# Altium schematic sheet Balancer-v7.0.1.SchDoc
size A4; SheetNumber: 1; SheetTotal: 1; ImagePath: C:\Users\eSpark\Documents\GitHub\eSpark-Hardware\Altium Template
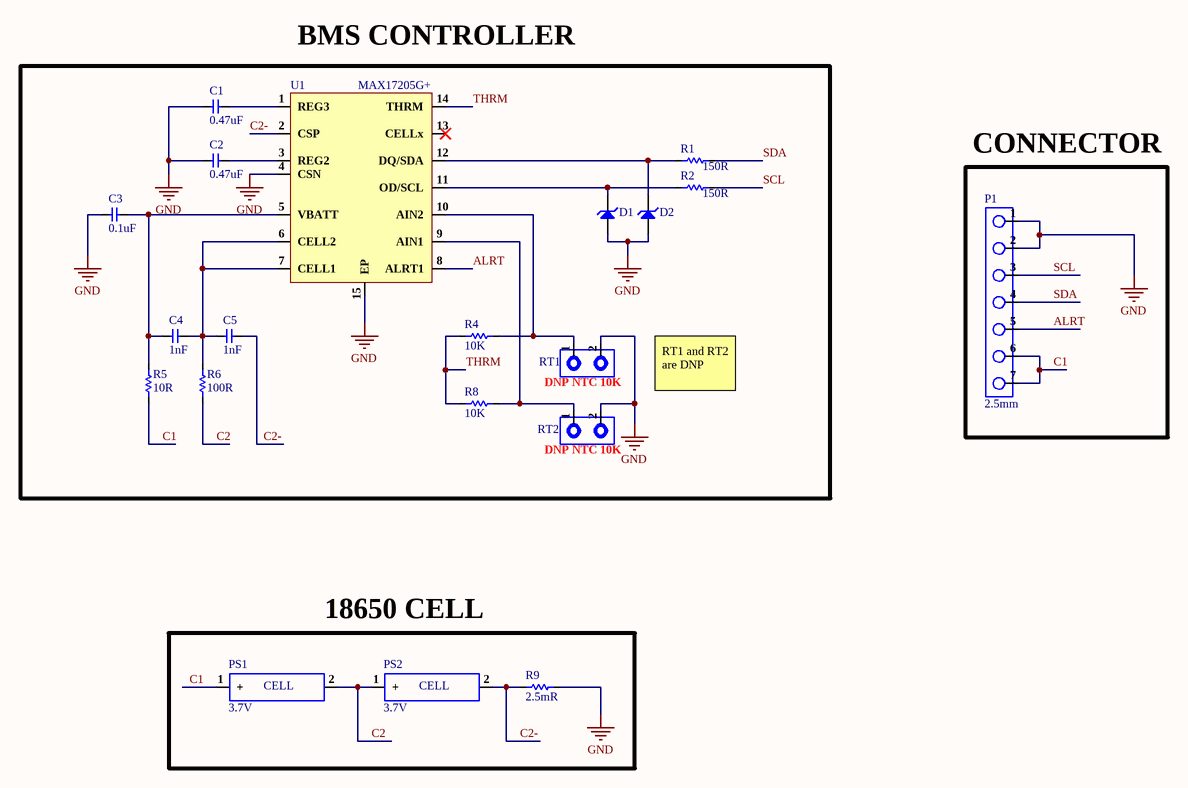
[diagram p0: Balancer-v7.0.1.SchDoc]

## Parts
C1  0.47uF  [Cap-0402]
C2  0.47uF  [Cap-0402]
C3  0.1uF  [Cap-0402]
C4  1nF  [Cap-0603]
C5  1nF  [Cap-0603]
D1  BZX38450-C4V7-QX  [SOD-323]  (value not drawn)
D2  BZX38450-C4V7-QX  [SOD-323]  (value not drawn)
P1  2.5mm  [Header CON]
PS1  3.7V  [18650 CELL PAD]
PS2  3.7V  [18650 CELL PAD]
R1  150R  [Res-0603]
R2  150R  [Res-0603]
R4  10K  [Res-0603]
R5  10R  [Res-1206]
R6  100R  [Res-1206]
R8  10K  [Res-0603]
R9  2.5mR  [RES-2512]
RT1  DNP NTC 10K  [Thermistor]
RT2  DNP NTC 10K  [Thermistor]
U1  MAX17205G+  [TDFN-14-EP(3x3)]

## Blocks framed on the sheet
BMS CONTROLLER: C1-C5 D1 D2 R1 R2 R4-R6 R8 RT1 RT2 U1
CONNECTOR: P1
18650 CELL: PS1 PS2 R9

## Nets
GND: C1.1 C2.1 C3.1 D1.2(A) D2.2(A) P1.1 P1.2 R9.2 RT1.2 RT2.2 U1.4(CSN) U1.15(EP)
ALRT: P1.5 U1.8(ALRT1)
C1: P1.6 P1.7 PS1.1(+) R5.1
C2: PS1.2(-) PS2.1(+) R6.1
C2-: C5.2 PS2.2(-) R9.1 U1.2(CSP)
SCL: P1.3 R2.2
SDA: P1.4 R1.2
THRM: R4.1 R8.1 U1.14(THRM)
NetC1_2: C1.2 U1.1(REG3)
NetC2_2: C2.2 U1.3(REG2)
NetC3_2: C3.2 C4.1 R5.2 U1.5(VBATT)
NetC4_2: C4.2 C5.1 R6.2 U1.6(CELL2) U1.7(CELL1)
NetD1_1: D1.1(K) R2.1 U1.11(OD/SCL)
NetD2_1: D2.1(K) R1.1 U1.12(DQ/SDA)
NetR4_2: R4.2 RT1.1 U1.10(AIN2)
NetR8_2: R8.2 RT2.1 U1.9(AIN1)

Not connected (* = marked no-connect by the designer): U1 13(CELLx)*

## Notes on the sheet
- RT1 and RT2 are DNP
- File:
- Title:
- Date:
- Page
- Num:
- Total:
- Drawn By: Huzaifa Ali
- (in symbol 18650 CELL) CELL

## Library data of the parts
C1 C2 = GRM155R71C474KE01D: CAP CER 0.47uF, 16V, X7R, 10% Tol, 0402 Multilayer Ceramic Capacitors MLCC - SMD/SMT ROHS; Manufacturer: Murata Electronics; Manufacturer Part Number: GRM155R71C474KE01D; Package: 0402; LCSC Part Number: C471404; Item Type: Capacitor
C3 = 04023C104KAT2A: CAP CER, 0.1 uF, 25 V, ± 10%, X7R, 0402 [1005 Metric]; Manufacturer: Kyocera AVX; Material: 4241ConductorMaterial; Value: 100nF; Voltage Rating (DC): 25V; Item Type: Capacitor; Supplier: Farnell; Supplier Part Number: 1867948; Manufacturer Part Number: 04023C104KAT2A; RoHS: Yes; Category: Ceramic Capacitors; Stock: 226682; Pricing: 10=0.027, 100=0.014, 500=0.009, 2500=0.007, 5000=0.0069 (GBP); Mounting Technology: Surface Mount; Case/Package: 0402; Pins: 2; Case Code (Metric): 1005; Case Code (Imperial): 0402; Min Operating Temperature: -55°C; Max Operating Temperature: 125°C; Tolerance: 10%; Dielectric: X7R; Packaging: Cut Tape; Voltage Rating: 25V; Voltage: 25V; Series: -; Width: 1mm; Reach SVHC Compliant: No; Lead Free: 5697LeadFree; RoHS Compliant: Yes; ComponentLink1URL: https://datasheet.ciiva.com/7614/cx7r-7614663.pdf?src-supplier=Digi-Key; ComponentLink1Description: https://datasheet.ciiva.com/7614/cx7r-7614663.pdf?src-supplier=Digi-Key; ComponentLink2URL: https://datasheet.ciiva.com/6265/cx7r-6265272.pdf?src-supplier=Digi-Key; ComponentLink2Description: https://datasheet.ciiva.com/6265/cx7r-6265272.pdf?src-supplier=Digi-Key; ComponentLink3URL: https://datasheet.ciiva.com/1123/1679506-1123344.pdf?src-supplier=Element14; ComponentLink3Description: https://datasheet.ciiva.com/1123/1679506-1123344.pdf?src-supplier=Element14; ComponentLink4URL: https://datasheet.ciiva.com/14906/cx7r-14906223.pdf?src-supplier=Digi-Key; ComponentLink4Description: https://datasheet.ciiva.com/14906/cx7r-14906223.pdf?src-supplier=Digi-Key; ComponentLink5URL: https://datasheet.ciiva.com/7709/1679506-7709527.pdf?src-supplier=Element14; ComponentLink5Description: https://datasheet.ciiva.com/7709/1679506-7709527.pdf?src-supplier=Element14; ComponentLink6Description: Farnell; ComponentLink6URL: https://uk.farnell.com/avx/04023c104kat2a/cap-0-1-f-25v-10-x7r-0402/dp/1867948
C4 C5 = C0603C102K3RACAUTO: CAP CER, 1000 pF, 25 V, ± 10%, X7R, 0603 [1608 Metric]; Manufacturer: KEMET; Dielectric Material: Ceramic; Voltage Rating: 25V; Item Type: Capacitor; Supplier: Newark; Supplier Part Number: 07X0745; Manufacturer Part Number: C0603C102K3RACAUTO; RoHS: Yes; Category: Ceramic Capacitors; Stock: 3765; Pricing: 1=0.014 (USD); Mounting Technology: Surface Mount; Package: 0603; Case Code (Metric): 1608; Case Code (Imperial): 0603; Min Operating Temperature: -55°C; Max Operating Temperature: 125°C; Value: 1nF; Tolerance: 10%; Package Quantity: 1; Packaging: Cut Tape; Dielectric: X7R; Voltage Rating (DC): 25V; Series: C; Construction: Flat; Length: 1.6mm; Width: 0.031inch; Height: 0.8mm; Thickness: 0.034inch; Depth: 0.8mm; Ratings: AEC-Q200; Radiation Hardening: No; RoHS Compliant: Yes; Reach SVHC Compliant: No; ComponentLink1URL: https://datasheet.ciiva.com/23913/1751276-23913166.pdf?src-supplier=Newark; ComponentLink1Description: https://datasheet.ciiva.com/23913/1751276-23913166.pdf?src-supplier=Newark; ComponentLink2URL: https://datasheet.ciiva.com/26847/getdatasheetpartid-429233-26847500.pdf?src-supplier=Verical; ComponentLink2Description: https://datasheet.ciiva.com/26847/getdatasheetpartid-429233-26847500.pdf?src-supplier=Verical; ComponentLink3Description: Newark; ComponentLink3URL: https://www.newark.com/kemet/c0603c102k3racauto/mlcc-capacitor-1000pf-25v-x7r/dp/07X0745
D1 D2 = BZX38450-C4V7-QX: Zener Diode 4.7 V 300 mW ±5% Surface Mount SOD-323; Manufacturer: Nexperia USA Inc.; Manufacturer Part Number: BZX38450-C4V7-QX; Package: SC-76, SOD-323; Item Type: Diode; ComponentLink1Description: Farnell; ComponentLink1URL: https://uk.farnell.com/nexperia/bzx38450-c4v7-qx/zener-diode-4-7v-0-3w-sc-76/dp/3868843; ComponentLink2Description: Digikey; ComponentLink2URL: https://www.digikey.com/en/products/detail/nexperia-usa-inc/BZX38450-C4V7-QX/16368564
P1 = Header CON 2.5mm: 2.5mm Pitch, 7 Pin header Connector
PS1 PS2 = 18650 CELL: Will only be pads on PCB for Welding. Not CELL holder
R1 R2 = MCWR06X1500FTL: SMD RES, 150 Ohm, General Purpose Thick Film 0603 1% 1/10W ±100ppm/°C Ceramic Paper T/R; Manufacturer: Multicomp; Voltage Rating: 50V; Power Rating: 100mW; Item Type: Resistor; Supplier: Farnell; Supplier Part Number: 2446572; Manufacturer Part Number: MCWR06X1500FTL; RoHS: Yes; Stock: 85000; Pricing: 5000=0.001, 25000=0.0009, 50000=0.0008 (GBP); Case/Package: 0603; Case Code (Metric): 1608; Case Code (Imperial): 0603; Value: 150R; Packaging: Tape and Reel; Resistor Type: Thick Film; Temperature Coefficient: 100ppm/°C; Voltage Rating (DC): 50V; Resistance Tolerance: 1%; Reach SVHC Compliant: No; ComponentLink1URL: http://www.farnell.com/datasheets/2563624.pdf?src-supplier=Farnell; ComponentLink1Description: http://www.farnell.com/datasheets/2563624.pdf?src-supplier=Farnell; ComponentLink2URL: http://www.farnell.com/datasheets/2860681.pdf?src-supplier=Farnell; ComponentLink2Description: http://www.farnell.com/datasheets/2860681.pdf?src-supplier=Farnell; ComponentLink3URL: https://datasheet.octopart.com/MCWR06X1500FTL-Multicomp-datasheet-100454308.pdf?src-supplier=Farnell; ComponentLink3Description: https://datasheet.octopart.com/MCWR06X1500FTL-Multicomp-datasheet-100454308.pdf?src-supplier=Farnell; ComponentLink4URL: http://www.farnell.com/datasheets/1849611.pdf?src-supplier=Element14; ComponentLink4Description: http://www.farnell.com/datasheets/1849611.pdf?src-supplier=Element14; ComponentLink5URL: http://www.farnell.com/datasheets/2563624.pdf?src-supplier=Newark; ComponentLink5Description: http://www.farnell.com/datasheets/2563624.pdf?src-supplier=Newark
R4 R8 = RE0603DRE0710KL: SMD RES, 10KOhm, ± 0.5%, 100 mW, 0603 [1608 Metric], Thick Film, Ultra Precision; Manufacturer: Yageo; Value: 10kR; Max Power Dissipation: 100mW; Temperature Coefficient: 50ppm/°C; Item Type: Resistor; Supplier: Farnell; Supplier Part Number: 1840588; Manufacturer Part Number: RE0603DRE0710KL; RoHS: Yes; Category: Chip SMD Resistors; Stock: 3920; Pricing: 10=0.025, 100=0.014, 500=0.013, 1000=0.011, 2500=0.009, 5000=0.007, 25000=0.006, 50000=0.005 (GBP); Case/Package: 0603; Min Operating Temperature: -55°C; Max Operating Temperature: 155°C; Packaging: Tape and Reel; Number of Terminations: 2; Tolerance: 0.5%; Features: Moisture Resistant; Series: RE; Length: 0.063inch; Width: 0.032inch; Height: 0.022inch; RoHS Compliant: Yes; ComponentLink1URL: http://www.yageo.com/NewPortal/yageodocoutput?fileName=/pdf/R-Chip/PYu-RE_105_RoHS_L_6.pdf&src-supplier=Digi-Key; ComponentLink1Description: http://www.yageo.com/NewPortal/yageodocoutput?fileName=/pdf/R-Chip/PYu-RE_105_RoHS_L_6.pdf&src-supplier=Digi-Key; ComponentLink2Description: Farnell; ComponentLink2URL: https://uk.farnell.com/yageo/re0603dr-0710kl/res-10k-0-5-0-1w-0603-thick-film/dp/1840588
R5 = RC1206FR-0710RL: SMD RES, 10 Ohm, ± 1%, 250 mW, 1206 [3216 Metric], Thick Film, General Purpose; Manufacturer: Yageo; Temperature Coefficient: 200ppm/°C; Voltage Rating (DC): 200V; Power Rating: 250mW; Item Type: Resistor; Supplier: Farnell; Supplier Part Number: 2421908; Manufacturer Part Number: RC1206FR-0710RL; RoHS: Yes; Category: Chip SMD Resistors; Stock: 95000; Pricing: 5000=0.016, 25000=0.014, 50000=0.012 (GBP); Case/Package: 1206; Pins: 2; Case Code (Metric): 3216; Package: 1206; Min Operating Temperature: -55°C; Max Operating Temperature: 155°C; Tolerance: 1%; Value: 10R; Resistor Type: Thick Film; Packaging: Tape and Reel; Voltage Rating: 200V; Number of Terminations: 2; Termination: SMD/SMT; Max Power Dissipation: 250mW; Features: Moisture Resistant; Series: RC; Resistance Tolerance: 1%; Technology: THICK FILM; Voltage Rating (AC): 200V; Length: 3.1mm; Width: 1.6mm; Height: 0.55mm; Depth: 1.6mm; Reach SVHC Compliant: No; Lead Free: Lead Free; RoHS Compliant: Yes; ComponentLink1URL: https://datasheet.ciiva.com/11819/0900766b80c6630a-11819896.pdf?src-supplier=Rs; ComponentLink1Description: https://datasheet.ciiva.com/11819/0900766b80c6630a-11819896.pdf?src-supplier=Rs; ComponentLink2URL: https://datasheet.ciiva.com/22735/444357-22735648.pdf?src-supplier=Farnell; ComponentLink2Description: https://datasheet.ciiva.com/22735/444357-22735648.pdf?src-supplier=Farnell; ComponentLink3URL: https://datasheet.ciiva.com/29181/402303-da-01-en-smd-widerstand-chip1206-10-ohm-29181572.pdf?src-supplier=Conrad; ComponentLink3Description: https://datasheet.ciiva.com/29181/402303-da-01-en-smd-widerstand-chip1206-10-ohm-29181572.pdf?src-supplier=Conrad; ComponentLink4URL: https://datasheet.ciiva.com/46445/444357-46445704.pdf?src-supplier=Element14; ComponentLink4Description: https://datasheet.ciiva.com/46445/444357-46445704.pdf?src-supplier=Element14; ComponentLink5URL: https://datasheet.ciiva.com/2460/pyu-rc1206-51-rohs-l-4-2460048.pdf?src-supplier=Digi-Key; ComponentLink5Description: https://datasheet.ciiva.com/2460/pyu-rc1206-51-rohs-l-4-2460048.pdf?src-supplier=Digi-Key; ComponentLink6URL: https://datasheet.ciiva.com/2460/pyu-rc1206-51-rohs-l-4-2460049.pdf?src-supplier=Digi-Key; ComponentLink6Description: https://datasheet.ciiva.com/2460/pyu-rc1206-51-rohs-l-4-2460049.pdf?src-supplier=Digi-Key; ComponentLink7URL: https://datasheet.ciiva.com/2460/pyu-rc1206-51-rohs-l-4-2460050.pdf?src-supplier=Digi-Key; ComponentLink7Description: https://datasheet.ciiva.com/2460/pyu-rc1206-51-rohs-l-4-2460050.pdf?src-supplier=Digi-Key; ComponentLink8URL: https://datasheet.ciiva.com/16962/pyu-rc1206-51-rohs-l-4-16962857.pdf?src-supplier=Future+Electronics; ComponentLink8Description: https://datasheet.ciiva.com/16962/pyu-rc1206-51-rohs-l-4-16962857.pdf?src-supplier=Future+Electronics; ComponentLink9Description: Farnell; ComponentLink9URL: https://uk.farnell.com/yageo/rc1206fr-0710rl/res-10r-1-0-25w-1206-thick-film/dp/2421908
R6 = RC1206FR-07100RL: SMD RES, 100 Ohm, ± 1%, 250 mW, 1206 [3216 Metric], Thick Film, General Purpose; Manufacturer: Yageo; Power Rating: 250mW; Voltage Rating: 200V; Temperature Coefficient: 100ppm/°C; Item Type: Resistor; Supplier: Farnell; Supplier Part Number: 9240888; Manufacturer Part Number: RC1206FR-07100RL; RoHS: Yes; Category: Chip SMD Resistors; Stock: 538979; Pricing: 10=0.022, 100=0.013, 500=0.011, 1000=0.009, 2500=0.0088 (GBP); Package: 1206; Case Code (Imperial): 1206; Case Code (Metric): 3216; Min Operating Temperature: -55°C; Max Operating Temperature: 155°C; Tolerance: 1%; Packaging: Tape and Reel; Value: 100R; Package Quantity: 5000; Termination: SMD/SMT; Resistor Type: Thick Film; Features: Moisture Resistant; Series: RC; Max Power Dissipation: 250mW; Number of Terminations: 2; Resistance Tolerance: 1%; Technology: THICK FILM; Voltage Rating (AC): 200V; Length: 3.1mm; Width: 1.6mm; Height: 0.55mm; Depth: 1.6mm; Lead Free: Lead Free; RoHS Compliant: Yes; Reach SVHC Compliant: Unknown; ComponentLink1URL: https://datasheet.ciiva.com/11808/0900766b80c6630a-11808606.pdf?src-supplier=Rs; ComponentLink1Description: https://datasheet.ciiva.com/11808/0900766b80c6630a-11808606.pdf?src-supplier=Rs; ComponentLink2URL: https://datasheet.ciiva.com/46445/444357-46445702.pdf?src-supplier=Element14; ComponentLink2Description: https://datasheet.ciiva.com/46445/444357-46445702.pdf?src-supplier=Element14; ComponentLink3URL: https://datasheet.ciiva.com/7857/444357-7857241.pdf?src-supplier=Element14; ComponentLink3Description: https://datasheet.ciiva.com/7857/444357-7857241.pdf?src-supplier=Element14; ComponentLink4URL: https://datasheet.ciiva.com/7857/444357-7857242.pdf?src-supplier=Element14; ComponentLink4Description: https://datasheet.ciiva.com/7857/444357-7857242.pdf?src-supplier=Element14; ComponentLink5Description: Farnell; ComponentLink5URL: https://uk.farnell.com/yageo/rc1206fr-07100rl/res-100r-1-0-25w-1206-thick-film/dp/9240888
R9 = PA2512FKF7W2U5E: SMD Current Sense Resistor, 0.0025 ohm, PA Series, 2512 [6432 Metric], 2W, ± 1%, Metal Strip; Manufacturer: YAGEO; ComponentLink1Description: Farnell; ComponentLink1URL: https://nl.farnell.com/yageo/pa2512fkf7w2u5e/res-r0025-1-2w-2512-metal-strip/dp/4169831; Manufacturer Part Number: PA2512FKF7W2U5E; Package: 2512; Item Type: Resistor
RT1 RT2 = Thermister: NTC Thermister 10K
U1 = MAX17205G+: Stand-Alone ModelGauge m5 Fuel Gauge with SHA-256 Authentication; Manufacturer: Maxim; Interface: I2C; Min Supply Voltage: 4.2V; Max Supply Voltage: 20V; Item Type: IC; Supplier 1: Digi-Key; Manufacturer Part Number: MAX17205G+; RoHS: Yes; Category: Battery Management; Stock 1: 490; Pricing 1: 1=6.58, 10=5.913, 25=5.5904, 80=4.845, 230=4.59652, 490=4.12443, 980=3.47844, 2450=3.30452 (USD); Number of Pins: 14; Min Operating Temperature: -40°C; Max Operating Temperature: 85°C; Series: ModelGauge™; Packaging: Rail/Tube; RoHS Compliant: Yes; Reach SVHC Compliant: Unknown; ComponentLink1URL: http://www.farnell.com/datasheets/2339113.pdf?src-supplier=Farnell; ComponentLink1Description: http://www.farnell.com/datasheets/2339113.pdf?src-supplier=Farnell; ComponentLink2URL: http://www.mouser.com/ds/2/256/MAX17201-MAX17215-909430.pdf?src-supplier=Mouser; ComponentLink2Description: http://www.mouser.com/ds/2/256/MAX17201-MAX17215-909430.pdf?src-supplier=Mouser; ComponentLink3URL: https://datasheets.maximintegrated.com/en/ds/MAX17201-MAX17215.pdf?src-supplier=Digi-Key; ComponentLink3Description: https://datasheets.maximintegrated.com/en/ds/MAX17201-MAX17215.pdf?src-supplier=Digi-Key; ComponentLink4URL: http://www.farnell.com/datasheets/2034561.pdf?src-supplier=Element14; ComponentLink4Description: http://www.farnell.com/datasheets/2034561.pdf?src-supplier=Element14; Package: TDFN-14-EP(3x3)